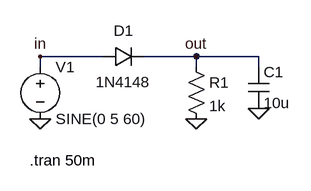
[diagram p0: schematic Rectificador de media onda.asc]
Rectificador de media onda.asc, the LTspice schematic file:
Version 4
SHEET 1 880 680
WIRE 96 0 0 0
WIRE 240 0 160 0
WIRE 336 0 240 0
WIRE 0 16 0 0
WIRE 240 16 240 0
WIRE 336 16 336 0
FLAG 0 96 0
FLAG 240 96 0
FLAG 336 80 0
FLAG 0 0 in
FLAG 240 0 out
SYMBOL voltage 0 0 R0
SYMATTR InstName V1
SYMATTR Value SINE(0 5 60)
SYMBOL diode 96 16 R270
WINDOW 0 40 32 VTop 2
WINDOW 3 -8 32 VBottom 2
SYMATTR InstName D1
SYMATTR Value 1N4148
SYMBOL res 224 0 R0
SYMATTR InstName R1
SYMATTR Value 1k
SYMBOL cap 320 16 R0
SYMATTR InstName C1
SYMATTR Value 10u
TEXT -16 160 Left 2 !.tran 50m

The netlist it stands for:
* Rectificador de media onda.asc
V1 in 0 SINE(0 5 60)
D1 in out 1N4148
R1 out 0 1k
C1 out 0 10u
.model D D
.lib standard.dio
.tran 50m
.backanno
.end